# Altium schematic sheet push-button-switch-4.SchDoc
size A4; SheetNumber: 4; SheetTotal: 17
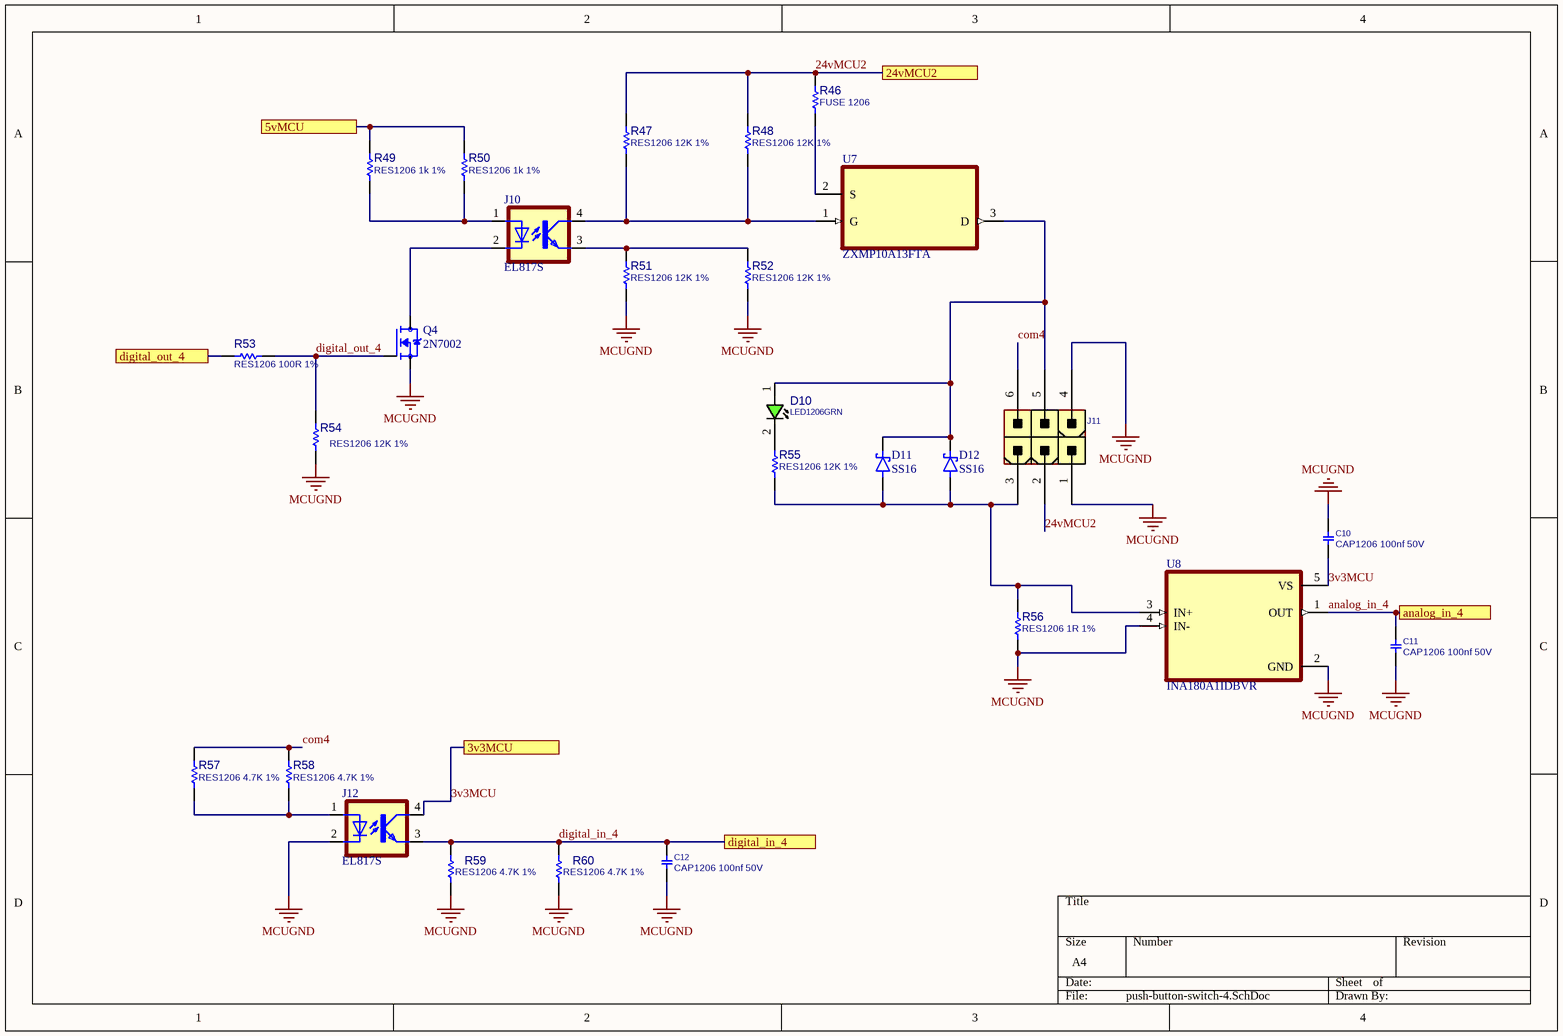
[diagram p0: push-button-switch-4.SchDoc]

## Parts
C10  CAP1206 100nf 50V  [C1206]
C11  CAP1206 100nf 50V  [C1206]
C12  CAP1206 100nf 50V  [C1206]
D10  LED1206GRN  [LED1206GRN]
D11  SS16  [DIOM4325X250N]
D12  SS16  [DIOM4325X250N]
J10  EL817S  [SOIC254P1030X460-4N]
J11  CONN_ATXPWR_6  [ATXPWR_6]  (value not drawn)
J12  EL817S  [SOIC254P1030X460-4N]
Q4  2N7002  [SOT95P240X111-3N]
R46  FUSE 1206  [R1206]
R47  RES1206 12K 1%  [R1206]
R48  RES1206 12K 1%  [R1206]
R49  RES1206 1k 1%  [R1206]
R50  RES1206 1k 1%  [R1206]
R51  RES1206 12K 1%  [R1206]
R52  RES1206 12K 1%  [R1206]
R53  RES1206 100R 1%  [R1206]
R54  RES1206 12K 1%  [R1206]
R55  RES1206 12K 1%  [R1206]
R56  RES1206 1R 1%  [R1206]
R57  RES1206 4.7K 1%  [R1206]
R58  RES1206 4.7K 1%  [R1206]
R59  RES1206 4.7K 1%  [R1206]
R60  RES1206 4.7K 1%  [R1206]
U7  ZXMP10A13FTA  [SOT95P230X110-3N]
U8  INA180A1IDBVR  [SOT95P280X145-5N]

## Ports
3v3MCU, 5vMCU, 24vMCU2, analog_in_4, digital_in_4, digital_out_4

## Nets
MCUGND: C10.1 C11.2 C12.2 J11.1 J11.4 J12.2(C) Q4.2(S) R51.2 R52.2 R54.2 R56.2 R59.1 R60.1 U8.2(GND) U8.4(IN-)
3v3MCU: C10.2 J12.4(COL) U8.5(VS) ; port 3v3MCU
5vMCU: R49.2 R50.2 ; port 5vMCU
24vMCU2: J11.2 R46.1 R47.1 R48.1 ; port 24vMCU2
analog_in_4: C11.1 U8.1(OUT) ; port analog_in_4
com4: J11.6 R57.2 R58.2
digital_in_4: C12.1 J12.3(EMIT) R59.2 R60.2 ; port digital_in_4
digital_out_4: Q4.1(G) R53.2 R54.1
digital_out_4: R53.1 ; port digital_out_4  [a separate net that carries the same name]
NetD10_1: D10.1(ANODE) D11.C(K) D12.C(K) J11.5 U7.3(D)
NetD10_2: D10.2(CATHODE) R55.1
NetD11_A: D11.A D12.A J11.3 R55.2 R56.1 U8.3(IN+)
NetJ10_1: J10.1(A) R49.1 R50.1
NetJ10_2: J10.2(C) Q4.3(D)
NetJ10_3: J10.3(EMIT) R51.1 R52.1
NetJ10_4: J10.4(COL) R47.2 R48.2 U7.1(G)
NetJ12_1: J12.1(A) R57.1 R58.1
NetR46_2: R46.2 U7.2(S)

## Library data of the parts
C10-C12 = CAP_SMD_MLCC_1206: CAP, MLCC; PARAM: -, -%; MANF_P#: MANF_PART#; PARAM2: -V; PRICE: 100= 1$; MANF: -; ASSEMBLY: ASSEMBLY
D10 = LED_SMD_1206_GRN: LED, SMD, 1206, GREEN; PARAM: 20mA; DESC: DESCRIPTION; PARAM2: 2.2V; MANF: -; ASSEMBLY: ASSEMBLY; PRICE: 36t@Javan; MANF_P#: -; VALUE: LED1206GRN; MountType: SMT; PartType: LED
D11 D12 = SS14: 1A, 40V, Schottky Rectifier; MF: Taiwan Semiconductor; SnapEDA_Link: https://www.snapeda.com/parts/SS14/taiwan/view-part/?ref=snap; Package: SMA-2 Taiwan Semiconductor; Value: *; MP: SS14; Check_prices: https://www.snapeda.com/parts/SS14/taiwan/view-part/?ref=eda
J10 J12 = EL817S: Optoisolator Transistor Output 5000Vrms 1 Channel 4-SMD; MF: Everlight Electronics; SnapEDA_Link: https://www.snapeda.com/parts/EL817S/Everlight+Electronics+Co+Ltd/view-part/?ref=snap; Package: SMD-4 Everlight Electronics Co Ltd; Value: *; MP: EL817S; Check_prices: https://www.snapeda.com/parts/EL817S/Everlight+Electronics+Co+Ltd/view-part/?ref=eda
J11 = CONN_ATXPWR_6: CONN, ATX POWER, 6 P; MANF: TE; MANF_P#: 4-1775099-1; VALUE: CONN_ATXPWR_6; MountType: THD; PACKAGE: ATXPWR-6pin; Part Type: Conn.
Q4 = 2N7002: N-Channel 60V 280mA (Ta) 350mW (Ta) Surface Mount SOT-23-3 (TO-236); MF: {'manufacturer': u'onsemi'}; Package: None; Price: None; Value: *; MP: 2N7002; Availability: Unavailable
R46-R60 = RES_SMD_1206: RESISTOR, SMD; PARAM: 1%, 0.25W; DESC: DESCRIPTION; DIST#: MOUSER; MANF_P#: -; MANF: -; ASSEMBLY: ASSEMBLY; PRICE: -; PARAM2: -
U7 = ZXMP10A13FTA: P-Channel 100 V 600mA (Ta) 625mW (Ta) Surface Mount SOT-23-3; MF: Diodes Inc.; Purchase-URL: https://pricing.snapeda.com/search/part/ZXMP10A13FTA/?ref=eda; Package: SOT-23-3 Diodes Inc.; SnapEDA_Link: https://www.snapeda.com/parts/ZXMP10A13FTA/Diodes+Inc./view-part/?ref=snap; Availability: In Stock; Value: *; MP: ZXMP10A13FTA; Check_prices: https://www.snapeda.com/parts/ZXMP10A13FTA/Diodes+Inc./view-part/?ref=eda; Price: None
U8 = INA180A1IDBVR: 26V, 350kHz current sense amplifier; MF: Texas Instruments; SnapEDA_Link: https://www.snapeda.com/parts/INA180A1IDBVR/Texas+Instruments/view-part/?ref=snap; Package: SOT-23-5 Texas Instruments; Value: *; MP: INA180A1IDBVR; Check_prices: https://www.snapeda.com/parts/INA180A1IDBVR/Texas+Instruments/view-part/?ref=eda